# Altium project Automotive USB-C Charger.PrjPcb (part 2 of 2)
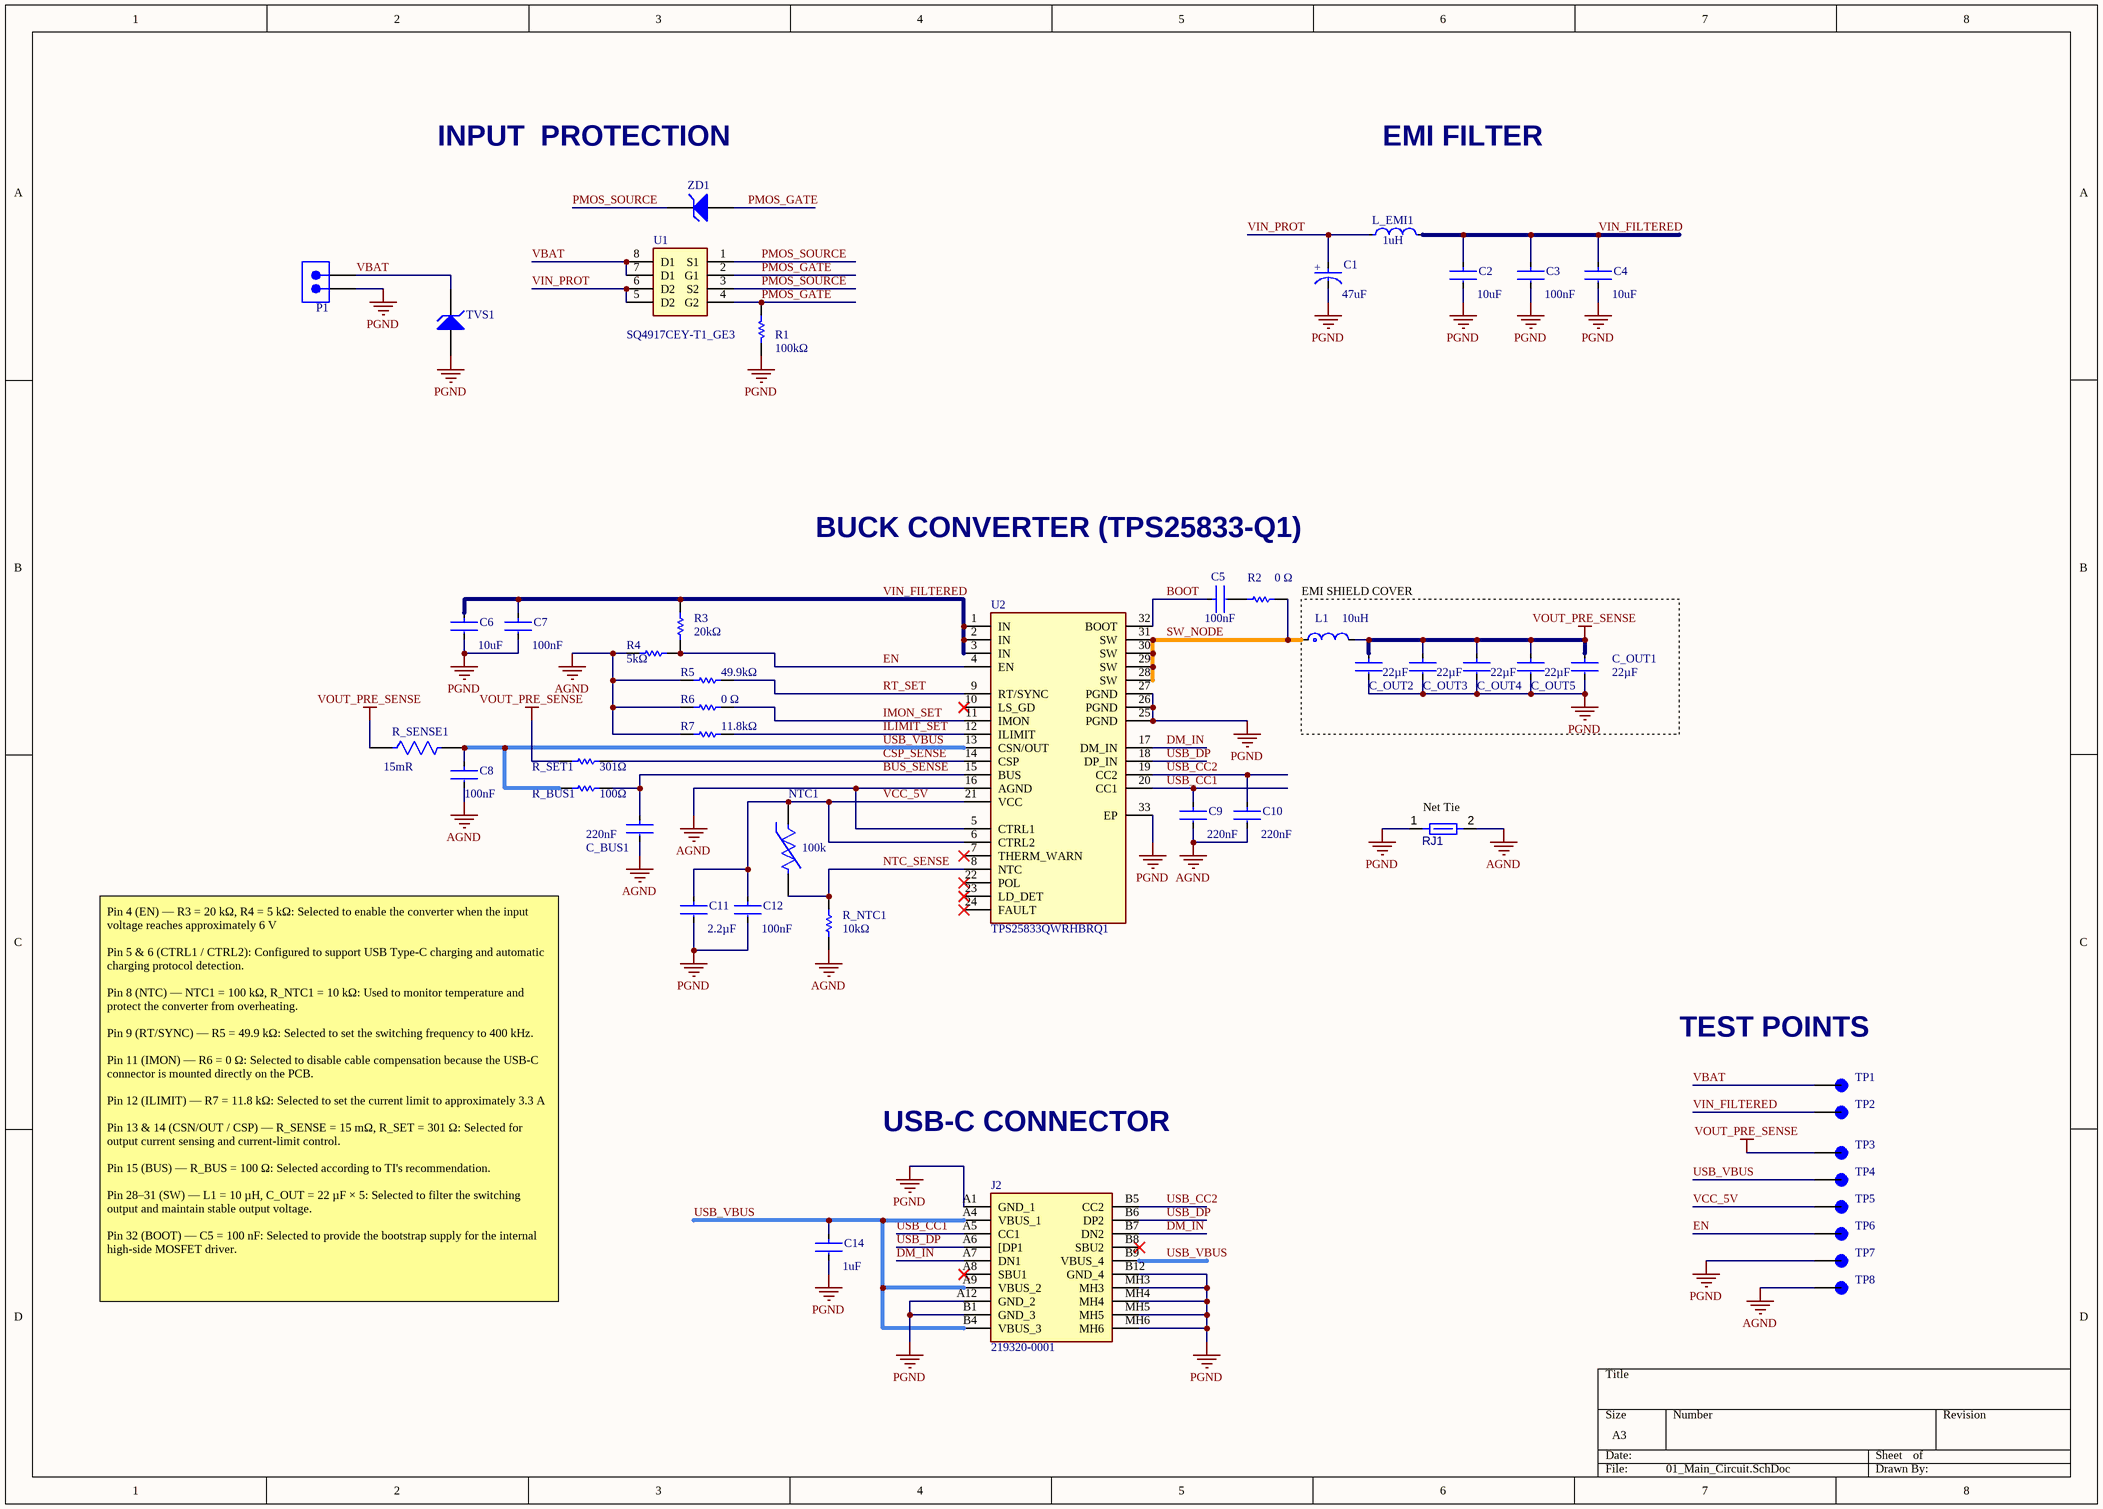
[diagram p1: 01_Main_Circuit.SchDoc]

## Sheet 01_Main_Circuit.SchDoc (continued)

### Library data of the parts
C1 = CMP-03015-000011-1: CAP ALUM 47UF 20% 50V SMD; RoHS Compliant: Yes
C2 C4 C6 = CMP-08246-001891-1: Cap Ceramic 10uF 50V X7R 10% Pad SMD 1206 +125°C Automotive T/R; Voltage Rating: 50V; Case/Package: 1206; Ratings: AEC-Q200; Mount: Surface Mount; Max Operating Temperature: 125°C; Min Operating Temperature: -55°C; Tolerance: 10%; Packaging: Tape and Reel; Case Code (Metric): 3216; Case Code (Imperial): 1206
C3 C5 C7 C8 = CMP-2000-07546-2: Cap Ceramic 100nF 50V X7R 10% Pad SMD 0603 +125°C Automotive T/R; Weight: 7.1E-05oz; Composition: Ceramic; Max Operating Temperature: 125°C; Termination: SMD/SMT; Dielectric: X7R; Length: 1.6mm; Package Quantity: 1; REACH SVHC: No SVHC; Lead Free: Lead Free; Case Code (Metric): 1608; Min Operating Temperature: -55°C; Packaging: Tape and Reel; Tolerance: 10%; Voltage Rating: 50V; Case Code (Imperial): 0603; Case/Package: 0603; Voltage Rating (DC): 50V; Depth: 0.8mm; Radiation Hardening: No; Ratings: AEC-Q200; Mount: Surface Mount; Voltage: 50V; Thickness: 0.035inch; Width: 0.8mm; Height: 0.8mm
C9 C10 C_BUS1 = CMP-2000-06086-2: 25V 220nF X5R 卤20% 0402 Multilayer Ceramic Capacitors MLCC - SMD/SMT ROHS; Manufacturer: TDK; Manufacturer Lifecycle Status: PRODUCTION (NOT RECOMMENDED FOR NEW DESIGN); Tolerance: 20%; Supplier: Avnet; Supplier Part Number: C1005X5R1E224M050BC; Manufacturer Part Number: C1005X5R1E224M050BC; RoHS: Compliant; Category: Ceramic Capacitors; Pricing: 10000=0.0212 (USD); Case/Package: 0402; Case Code (Imperial): 0402; Case Code (Metric): 1005; China RoHS: Compliant; Composition: Ceramic; Depth: 500µm; Dielectric: X5R; Dielectric Material: Ceramic; Export Control Classification Number (ECCN) Code: EAR99; Height: 500µm; Harmonized Tariff Schedule (HTS) Code: 8532.24.00.20; Introduction Date: 2012-08-21; Lead Free: Lead Free; Length: 1mm; Lifecycle Status: NRND; Material: Ceramic; Max Length: 1.05mm; Max Operating Temperature: 85°C; Max Width: 550µm; Min Length: 950µm; Min Operating Temperature: -55°C; Min Width: 450µm; Mounting Technology: Surface Mount; Number of Terminals: 2; REACH SVHC: Unaffected; Termination: SMD/SMT; Voltage Rating: 25V; Voltage Rating (DC): 25V; Weight: 652.039032µg; Width: 500µm; ComponentLink1URL: https://datasheet.octopart.com:443/C1005X5R1E224M050BC-TDK-datasheet-175423548.pdf?src-supplier=IHS; ComponentLink1Description: https://datasheet.octopart.com:443/C1005X5R1E224M050BC-TDK-datasheet-175423548.pdf?src-supplier=IHS; ComponentLink2URL: https://datasheet.octopart.com:443/C1005X5R1E224M050BC-TDK-datasheet-151546523.pdf?src-supplier=TDK; ComponentLink2Description: https://datasheet.octopart.com:443/C1005X5R1E224M050BC-TDK-datasheet-151546523.pdf?src-supplier=TDK; ComponentLink3URL: https://datasheet.octopart.com/C1005X5R1E224M050BC-TDK-datasheet-41194876.pdf; ComponentLink3Description: https://datasheet.octopart.com/C1005X5R1E224M050BC-TDK-datasheet-41194876.pdf; ComponentLink4URL: https://datasheet.octopart.com/C-Series-Ceramic-Chip-Capacitors-TDK-datasheet-family-84.pdf; ComponentLink4Description: https://datasheet.octopart.com/C-Series-Ceramic-Chip-Capacitors-TDK-datasheet-family-84.pdf; ComponentLink5URL: https://datasheet.octopart.com:443/C1005X5R1E224M050BC-TDK-datasheet-82475248.pdf?src-supplier=Newark; ComponentLink5Description: https://datasheet.octopart.com:443/C1005X5R1E224M050BC-TDK-datasheet-82475248.pdf?src-supplier=Newark; ComponentLink6URL: https://datasheet.octopart.com:443/C1005X5R1E224M050BC-TDK-datasheet-13444418.pdf?src-supplier=Future+Electronics; ComponentLink6Description: https://datasheet.octopart.com:443/C1005X5R1E224M050BC-TDK-datasheet-13444418.pdf?src-supplier=Future+Electronics; ComponentLink7URL: https://datasheet.octopart.com:443/C1005X5R1E224M050BC-TDK-datasheet-17817446.pdf?src-supplier=Future+Electronics; ComponentLink7Description: https://datasheet.octopart.com:443/C1005X5R1E224M050BC-TDK-datasheet-17817446.pdf?src-supplier=Future+Electronics; ComponentLink8URL: https://datasheet.octopart.com:443/C1005X5R1E224M050BC-TDK-datasheet-10921857.pdf?src-supplier=Electro+Sonic; ComponentLink8Description: https://datasheet.octopart.com:443/C1005X5R1E224M050BC-TDK-datasheet-10921857.pdf?src-supplier=Electro+Sonic; ComponentLink9URL: http://sigma.octopart.com:80/rohs_certificate/C-Series-Ceramic-Chip-Capacitors-TDK-family-108.pdf?src-supplier=Compliance+Statements; ComponentLink9Description: http://sigma.octopart.com:80/rohs_certificate/C-Series-Ceramic-Chip-Capacitors-TDK-family-108.pdf?src-supplier=Compliance+Statements
C11 = CMP-2000-06086-2: 25V 2.2uF X5R ±10% 0402 Multilayer Ceramic Capacitors MLCC - SMD/SMT ROHS; Manufacturer: Murata; Manufacturer Lifecycle Status: IN PRODUCTION; Supplier: Future Electronics; Supplier Part Number: GRT155R61E225KE13D; Manufacturer Part Number: GRT155R61E225KE13D; RoHS: Compliant; Category: Ceramic Capacitors; Stock: 170000; Pricing: 10000=0.168 (USD); Case/Package: 0402; Case Code (Imperial): 0402; Case Code (Metric): 1005; Dielectric: X5R; Dielectric Material: Ceramic; Export Control Classification Number (ECCN) Code: EAR99; Height: 500µm; Harmonized Tariff Schedule (HTS) Code: 8532.24.00.20; Introduction Date: 2016-01-27; Length: 1mm; Lifecycle Status: Production; Material: Ceramic; Max Operating Temperature: 85°C; Min Operating Temperature: -55°C; Mounting Technology: Surface Mount; Number of Terminals: 2; Packaging: Cut Tape; Ratings: AEC-Q200; REACH SVHC: Unaffected; Schedule B: 8532240020, 8532240020|8532240020, 8532240020|8532240020|8532240020, 8532240020|8532240020|8532240020|8532240020; Tolerance: 10%; Voltage Rating: 25V; Voltage Rating (DC): 25V; Width: 500µm; ComponentLink1URL: https://datasheet.octopart.com:443/GRT155R61E225KE13D-Murata-datasheet-149523572.pdf?src-supplier=Farnell; ComponentLink1Description: https://datasheet.octopart.com:443/GRT155R61E225KE13D-Murata-datasheet-149523572.pdf?src-supplier=Farnell; ComponentLink2URL: https://datasheet.octopart.com:443/GRT155R61E225KE13D-Murata-datasheet-67697706.pdf?src-supplier=Newark; ComponentLink2Description: https://datasheet.octopart.com:443/GRT155R61E225KE13D-Murata-datasheet-67697706.pdf?src-supplier=Newark; ComponentLink3URL: https://datasheet.octopart.com:443/GRT155R61E225KE13D-Murata-datasheet-141283924.pdf?src-supplier=Geoflip; ComponentLink3Description: https://datasheet.octopart.com:443/GRT155R61E225KE13D-Murata-datasheet-141283924.pdf?src-supplier=Geoflip; ComponentLink4URL: https://datasheet.octopart.com:443/GRT155R61E225KE13D-Murata-datasheet-178522875.pdf?src-supplier=Arrow.cn; ComponentLink4Description: https://datasheet.octopart.com:443/GRT155R61E225KE13D-Murata-datasheet-178522875.pdf?src-supplier=Arrow.cn; ComponentLink5URL: https://datasheet.octopart.com:443/GRT155R61E225KE13D-Murata-datasheet-165579666.pdf?src-supplier=TME; ComponentLink5Description: https://datasheet.octopart.com:443/GRT155R61E225KE13D-Murata-datasheet-165579666.pdf?src-supplier=TME; ComponentLink6URL: https://datasheet.octopart.com:443/GRT155R61E225KE13D-Murata-datasheet-140711002.pdf?src-supplier=Ciiva; ComponentLink6Description: https://datasheet.octopart.com:443/GRT155R61E225KE13D-Murata-datasheet-140711002.pdf?src-supplier=Ciiva; ComponentLink7URL: https://datasheet.octopart.com:443/GRT155R61E225KE13D-Murata-datasheet-138748731.pdf?src-supplier=Ciiva; ComponentLink7Description: https://datasheet.octopart.com:443/GRT155R61E225KE13D-Murata-datasheet-138748731.pdf?src-supplier=Ciiva; ComponentLink8URL: https://datasheet.octopart.com:443/GRT155R61E225KE13D-Murata-datasheet-82944872.pdf?src-supplier=Future+Electronics; ComponentLink8Description: https://datasheet.octopart.com:443/GRT155R61E225KE13D-Murata-datasheet-82944872.pdf?src-supplier=Future+Electronics; ComponentLink9URL: http://sigma.octopart.com:80/reach_statement/Murata-company-16.pdf?src-supplier=Compliance+Statements; ComponentLink9Description: http://sigma.octopart.com:80/reach_statement/Murata-company-16.pdf?src-supplier=Compliance+Statements
C12 = CMP-2000-06086-2: Cap Ceramic 100nF 25V X7R 10% Pad SMD 0402 +125°C Automotive T/R; Lead Free: Lead Free; Termination: SMD/SMT; Voltage Rating: 25V; Voltage: 25V; Composition: Ceramic; Case/Package: 0402; Mount: Surface Mount; Voltage Rating (DC): 25V; Tolerance: 10%; Length: 1mm; Width: 0.02inch; REACH SVHC: No SVHC; Max Operating Temperature: 125°C; Case Code (Metric): 1005; Case Code (Imperial): 0402; Package Quantity: 1; Depth: 0.5mm; Min Operating Temperature: -55°C; Thickness: 0.022inch; Height: 0.5mm; Dielectric: X7R; Packaging: Tape and Reel; Weight: 2.3E-05oz; Ratings: AEC-Q200
C14 = CMP-08246-000763-1: Cap Ceramic 1uF 10V X5R 10% Pad SMD 0603 +85°C Automotive T/R; Case/Package: 0603; Height: 0.8mm; Mount: Surface Mount; Voltage Rating: 10V; Tolerance: 10%; Thickness: 0.035inch; Dielectric: X5R; Case Code (Metric): 1608; Ratings: AEC-Q200; Package Quantity: 4000; Packaging: Tape and Reel; Width: 0.031inch; Voltage Rating (DC): 10V; Case Code (Imperial): 0603; Max Operating Temperature: 85°C; Weight: 7.1E-05oz; Min Operating Temperature: -55°C; Length: 0.063inch
C_OUT1-C_OUT5 = CMP-08246-001891-1: CAP CER 22UF 25V X5R 1206 / 22 µF ±10% 25V Ceramic Capacitor X5R 1206 (3216 Metric); Manufacturer: Murata; Manufacturer Lifecycle Status: NRND; Supplier: Arrow Electronics; Supplier Part Number: GRT31CR61E226KE01L; Manufacturer Part Number: GRT31CR61E226KE01L; RoHS: Compliant; Category: Ceramic Capacitors; Stock: 257; Pricing: 44=1.6387, 100=1.5267 (USD); Case/Package: 1206; Case Code (Imperial): 1206; Case Code (Metric): 3216; Dielectric: X5R; Dielectric Material: Ceramic; Export Control Classification Number (ECCN) Code: EAR99; Height: 1.6mm; Harmonized Tariff Schedule (HTS) Code: 8532.24.00.20; Introduction Date: 2016-01-27; Length: 3.2mm; Lifecycle Status: NRND; Max Operating Temperature: 85°C; Min Operating Temperature: -55°C; Mounting Technology: Surface Mount; Number of Terminals: 2; Packaging: Cut Tape; Ratings: AEC-Q200; REACH SVHC: Unaffected; Schedule B: 8532240020, 8532240020|8532240020|8532240020|8532240020|8532240020; Tolerance: 10%; Voltage Rating: 25V; Voltage Rating (DC): 25V; Width: 1.6mm; ComponentLink1URL: https://datasheet.octopart.com:443/GRT31CR61E226KE01L-Murata-datasheet-67697882.pdf?src-supplier=HQonline; ComponentLink1Description: https://datasheet.octopart.com:443/GRT31CR61E226KE01L-Murata-datasheet-67697882.pdf?src-supplier=HQonline; ComponentLink2URL: https://datasheet.octopart.com:443/GRT31CR61E226KE01L-Murata-datasheet-141285200.pdf?src-supplier=Geoflip; ComponentLink2Description: https://datasheet.octopart.com:443/GRT31CR61E226KE01L-Murata-datasheet-141285200.pdf?src-supplier=Geoflip; ComponentLink3URL: https://datasheet.octopart.com:443/GRT31CR61E226KE01L-Murata-datasheet-140711510.pdf?src-supplier=Ciiva; ComponentLink3Description: https://datasheet.octopart.com:443/GRT31CR61E226KE01L-Murata-datasheet-140711510.pdf?src-supplier=Ciiva; ComponentLink4URL: https://datasheet.octopart.com:443/GRT31CR61E226KE01L-Murata-datasheet-138749569.pdf?src-supplier=Ciiva; ComponentLink4Description: https://datasheet.octopart.com:443/GRT31CR61E226KE01L-Murata-datasheet-138749569.pdf?src-supplier=Ciiva; ComponentLink5URL: https://datasheet.octopart.com:443/GRT31CR61E226KE01L-Murata-datasheet-128593529.pdf?src-supplier=X-ON; ComponentLink5Description: https://datasheet.octopart.com:443/GRT31CR61E226KE01L-Murata-datasheet-128593529.pdf?src-supplier=X-ON; ComponentLink6URL: http://sigma.octopart.com:80/reach_statement/Murata-company-16.pdf?src-supplier=Compliance+Statements; ComponentLink6Description: http://sigma.octopart.com:80/reach_statement/Murata-company-16.pdf?src-supplier=Compliance+Statements
J2 = 219320-0001: Universal Serial Bus (USB) Shielded I/O Receptacle, Type C, Vertical, Surface Mount, Height 8.8mm, 16 Circuits, Gold (Au) Flash Plating; Manufacturer_Name: Molex; Geometry.Height: 9.05mm; Mouser Part Number: 538-219320-0001; Mouser Price/Stock: https://www.mouser.co.uk/ProductDetail/Molex/219320-0001?qs=rQFj71Wb1eXha8qVBIXu3A%3D%3D; Manufacturer_Part_Number: 219320-0001; Datasheet Link: https://www.molex.com/content/dam/molex/molex-dot-com/products/automated/en-us/salesdrawingpdf/219/219320/2193200001_sd.pdf?inline
L1 = CMP-11268-000112-1: Power inductor, shielded,10uH 20% tol, 29.82mOhms, SMT, RoHS, Halogen Free, AEC - Q200; Self Resonant Frequency: 14MHz; Core Material: Composite; Max DC Current: 7A; Test Frequency: 100kHz; DC Resistance (DCR): 29.82mR; Package Quantity: 21; Length: 6.76mm; RoHS Compliant: Yes; Min Operating Temperature: -40°C; Tolerance: 20%; Max Operating Temperature: 125°C; Series: XAL6060; Termination: SMD/SMT; Shielding: Shielded; Height: 6.1mm; Lead Free: Contains Lead; Width: 6.56mm; Packaging: Tape and Reel
L_EMI1 = CMP-11268-000037-1: Fixed Inductors 1uH 20% 9.6A 14.60mOhms AEC-Q200; Manufacturer: Coilcraft; Saturation Current: 8.7A; Core Material: Composite; Test Frequency: 1MHz; Standoff Height: 0.1mm; Shielding: true; Automotive Grade: Grade 1; Self Resonant Frequency: 79MHz; Series Resistance: 14.6mΩ; Rms Current: 9.6A; Category: Ind; RoHS: TRUE; Device Class L2: Inductors; Mouser Description: Power inductor, shielded, 20% tol, SMT, RoHS, halogen f; Lead Free: Yes; Device Class L1: Passive Components; Inductance: 1uH; ComponentLink2URL: https://www.coilcraft.com/pdfs/xal4000.pdf; Height: 2.1mm; Device Class L3: Fixed Inductors; Composition: Wirewound; Package: 0; Ambient Temperature Range Low: -40°C; Automotive: Yes; Ambient Temperature Range High: +125°C; ComponentLink2Description: Datasheet; Octopart: https://octopart.com/xal4020-102mec-coilcraft-13142161; Tolerance: 20%; Manufacturer Part Number: XAL4020-102MEC
NTC1 = CMP-06022-000152-2: THERMISTOR NTC; Max Operating Temperature: 150°C; RoHS Compliant: Yes; Min Operating Temperature: -40°C; REACH SVHC: No SVHC; Case Code (Imperial): 0603; Case Code (Metric): 1608
P1 = CMP-03913-107328823-2: Conn, R/A Hdr, Stamped Tab, 2P, 5.08Mm Rohs Compliant: Yes; Gender: Male
R1 = CMP-1012-00736-1: 100K 0.1W 1% 0603 (1608 Metric)  SMD; Case-Metric: 1608; Case-EIA: 0603; Power: 0.1 W; Tolerance: 1 %; Technology: SMT
R2 R6 = CMP-2000-07451-1: Chip Resistor, 0 Ohm, 0.1 W, -55 to 155 degC, 0402 (1005 Metric), RoHS, Tape and Reel; Manufacturer: Panasonic; Voltage Rating (DC): 50V; Temperature Coefficient: 600ppm/��C; Max Power Dissipation: 100mW; Tolerance: 5%; Number of Terminations: 2; Mount: SurfaceMount; Height: 0.35mm; Packaging: TapeandReel; Contact Plating: Tin; Manufacturer URL: http://www.panasonic.com/; Composition: ThickFilm; Max Operating Temperature: 155degC; REACH SVHC: NoSVHC; Case/Package: 0402; Package Reference: 402; Depth: 0.5mm; Package Description: 2-Pin Surface Mount Device, Body 1 x 0.5 mm; Datasheet URL: https://industrial.panasonic.com/cdbs/www-data/pdf/RDA0000/AOA0000C301.pdf; RoHSCompliant: True; Case Code (Imperial): 0402; Military Standard: Not; Min Operating Temperature: -55degC; Power Rating: 100mW; Datasheet Version: 03/2015; Length: 1mm; Case Code (Metric): 1005; Termination: SMD/SMT; Mounting Technology: SurfaceMount; Voltage Rating: 50V; Width: 0.02inch; Package Quantity: 1; Lead Free: LeadFree; Radiation Hardening: No
R3 = CMP-2000-07451-1: Manufacturer: Yageo Group; Manufacturer Part Number: AC0402FR-7W20KL; Power Rating: 125mW; Temperature Coefficient: 100ppm/°C; Tolerance: 1%; Voltage Rating: 50V; Working Voltage: 75V; Supplier: Future Electronics; Supplier Part Number: AC0402FR-7W20KL; RoHS: Compliant; Category: Chip SMD Resistors; Stock: 120000; Pricing: 10000=0.0077, 30000=0.0075, 50000=0.0074, 100000=0.0073, 200000=0.0071 (USD); Case/Package: 0402; China RoHS: Non-Compliant; Composition: Thick Film; Country of Origin: Mainland China, Taiwan; Export Control Classification Number (ECCN) Code: EAR99; Height: 320µm; Harmonized Tariff Schedule (HTS) Code: 8533.21.00.30; Introduction Date: 2017-06-20; Length: 1mm; Lifecycle Status: Production; Max Operating Temperature: 155°C; Min Operating Temperature: -55°C; Mounting Technology: Surface Mount; Number of Terminals: 2; Packaging: Tape & Reel; Ratings: AEC-Q200; REACH SVHC: Unaffected; Width: 500µm; ComponentLink1URL: https://datasheet.octopart.com:443/AC0402FR-7W20KL-Yageo-datasheet-182189377.pdf?src-supplier=IHS; ComponentLink1Description: https://datasheet.octopart.com:443/AC0402FR-7W20KL-Yageo-datasheet-182189377.pdf?src-supplier=IHS; ComponentLink2URL: https://datasheet.octopart.com:443/AC0402FR-7W20KL-Yageo-datasheet-83209224.pdf?src-supplier=Upverter; ComponentLink2Description: https://datasheet.octopart.com:443/AC0402FR-7W20KL-Yageo-datasheet-83209224.pdf?src-supplier=Upverter; ComponentLink3URL: https://datasheet.octopart.com:443/AC0402FR-7W20KL-Yageo-datasheet-178509465.pdf?src-supplier=Farnell; ComponentLink3Description: https://datasheet.octopart.com:443/AC0402FR-7W20KL-Yageo-datasheet-178509465.pdf?src-supplier=Farnell; ComponentLink4URL: https://datasheet.octopart.com:443/AC0402FR-7W20KL-Yageo-datasheet-166720450.pdf?src-supplier=Future+Electronics; ComponentLink4Description: https://datasheet.octopart.com:443/AC0402FR-7W20KL-Yageo-datasheet-166720450.pdf?src-supplier=Future+Electronics; ComponentLink5URL: https://datasheet.octopart.com:443/AC0402FR-7W20KL-Yageo-datasheet-151884373.pdf?src-supplier=Future+Electronics; ComponentLink5Description: https://datasheet.octopart.com:443/AC0402FR-7W20KL-Yageo-datasheet-151884373.pdf?src-supplier=Future+Electronics; ComponentLink6URL: https://datasheet.octopart.com:443/AC0402FR-7W20KL-Yageo-Group-datasheet-159083007.pdf?src-supplier=HQonline; ComponentLink6Description: https://datasheet.octopart.com:443/AC0402FR-7W20KL-Yageo-Group-datasheet-159083007.pdf?src-supplier=HQonline; ComponentLink7URL: https://datasheet.octopart.com/AC0402FR-7W20KL-Yageo-datasheet-12512238.pdf; ComponentLink7Description: https://datasheet.octopart.com/AC0402FR-7W20KL-Yageo-datasheet-12512238.pdf; ComponentLink8URL: http://sigma.octopart.com:80/conflict_mineral_statement/Yageo-company-3.pdf?src-supplier=Compliance+Statements; ComponentLink8Description: http://sigma.octopart.com:80/conflict_mineral_statement/Yageo-company-3.pdf?src-supplier=Compliance+Statements; ComponentLink9URL: http://sigma.octopart.com:80/rohs_statement/Yageo-company-2.pdf?src-supplier=Compliance+Statements; ComponentLink9Description: http://sigma.octopart.com:80/rohs_statement/Yageo-company-2.pdf?src-supplier=Compliance+Statements
R4 = CMP-2000-07451-1: Manufacturer: Yageo Group; Manufacturer Part Number: RC0402FR-075KL; Max Power Dissipation: 63mW; Power Rating: 62.5mW; Temperature Coefficient: 100ppm/°C; Tolerance: 1%; Voltage Rating: 50V; Supplier: Avnet; Supplier Part Number: RC0402FR-075KL; RoHS: Compliant; Category: Chip SMD Resistors; Stock: 9552; Pricing: 1=0.101, 25=0.011, 100=0.010, 250=0.009, 500=0.008, 1000=0.007, 2500=0.005 (USD); Case/Package: 0402; China RoHS: Non-Compliant; Composition: Thick Film; Country of Origin: Mainland China, Taiwan; Export Control Classification Number (ECCN) Code: EAR99; Features: Moisture Resistant; Height: 350µm; Harmonized Tariff Schedule (HTS) Code: 8533.21.00.30; Introduction Date: 2011-11-17; Length: 1mm; Lifecycle Status: Production; Max Operating Temperature: 155°C; Min Operating Temperature: -55°C; Mounting Technology: Surface Mount; Number of Terminals: 2; Number of Terminations: 2; REACH SVHC: Unaffected; Schedule B: 8533210045, 8533210045|8533210045|8533210045|8533210045|8533210045; Width: 500µm; Working Voltage: 50V; ComponentLink1URL: https://datasheet.octopart.com:443/RC0402FR-075KL-Yageo-datasheet-127823281.pdf?src-supplier=Upverter; ComponentLink1Description: https://datasheet.octopart.com:443/RC0402FR-075KL-Yageo-datasheet-127823281.pdf?src-supplier=Upverter; ComponentLink2URL: https://datasheet.octopart.com:443/RC0402FR-075KL-Yageo-datasheet-137700087.pdf?src-supplier=IHS; ComponentLink2Description: https://datasheet.octopart.com:443/RC0402FR-075KL-Yageo-datasheet-137700087.pdf?src-supplier=IHS; ComponentLink3URL: https://datasheet.octopart.com:443/RC0402FR-075KL-Yageo-Group-datasheet-176638170.pdf?src-supplier=Future+Electronics; ComponentLink3Description: https://datasheet.octopart.com:443/RC0402FR-075KL-Yageo-Group-datasheet-176638170.pdf?src-supplier=Future+Electronics; ComponentLink4URL: https://datasheet.octopart.com:443/RC0402FR-075KL-Yageo-datasheet-164759695.pdf?src-supplier=Future+Electronics; ComponentLink4Description: https://datasheet.octopart.com:443/RC0402FR-075KL-Yageo-datasheet-164759695.pdf?src-supplier=Future+Electronics; ComponentLink5URL: https://datasheet.octopart.com:443/RC0402FR-075KL-Yageo-datasheet-175887523.pdf?src-supplier=Newark; ComponentLink5Description: https://datasheet.octopart.com:443/RC0402FR-075KL-Yageo-datasheet-175887523.pdf?src-supplier=Newark; ComponentLink6URL: https://datasheet.octopart.com/RC0402FR-075KL-Yageo-datasheet-73766026.pdf; ComponentLink6Description: https://datasheet.octopart.com/RC0402FR-075KL-Yageo-datasheet-73766026.pdf; ComponentLink7URL: http://sigma.octopart.com:80/conflict_mineral_statement/Yageo-company-3.pdf?src-supplier=Compliance+Statements; ComponentLink7Description: http://sigma.octopart.com:80/conflict_mineral_statement/Yageo-company-3.pdf?src-supplier=Compliance+Statements; ComponentLink8URL: http://sigma.octopart.com:80/rohs_statement/Yageo-company-2.pdf?src-supplier=Compliance+Statements; ComponentLink8Description: http://sigma.octopart.com:80/rohs_statement/Yageo-company-2.pdf?src-supplier=Compliance+Statements
R5 = CMP-2000-07451-1: Manufacturer: Panasonic; Manufacturer Part Number: ERJ2RKF4992X; Manufacturer Lifecycle Status: ACTIVE; Part Series: Precision Thick Film Chip Resistors; Max Power Dissipation: 100mW; Temperature Coefficient: 100ppm/°C; Tolerance: 1%; Voltage Rating: 50V; Supplier: Future Electronics; Supplier Part Number: ERJ-2RKF4992X; RoHS: Compliant; Category: Chip SMD Resistors; Stock: 150000; Pricing: 10000=0.0105, 30000=0.0102, 50000=0.0099, 150000=0.0097, 250000=0.0094 (USD); Case/Package: 0402; Case Code (Imperial): 0402; China RoHS: Non-Compliant; Composition: Thick Film; Contact Plating: Tin; Country of Origin: Japan, Mainland China; Depth: 500µm; Export Control Classification Number (ECCN) Code: EAR99; Features: Automotive AEC-Q200; Height: 350µm; Harmonized Tariff Schedule (HTS) Code: 8533.21.00.30; Introduction Date: 2004-02-02; Lead Free: Lead Free; Length: 1mm; Lifecycle Status: Production; Max Operating Temperature: 155°C; Military Standard: Not; Min Operating Temperature: -55°C; Mounting Technology: Surface Mount; Number of Terminals: 2; Number of Terminations: 2; Packaging: Cut Tape; Power Rating: 100mW; Radiation Hardening: No; Ratings: AEC-Q200; REACH SVHC: Unaffected; Schedule B: 8533210045, 8533210045|8533210045|8533210045|8533210045|8533210045; Termination: SMD/SMT; Voltage Rating (DC): 50V; Width: 500µm; Working Voltage: 50V; ComponentLink1URL: https://datasheet.octopart.com:443/ERJ2RKF4992X-Panasonic-datasheet-82288794.pdf?src-supplier=Upverter; ComponentLink1Description: https://datasheet.octopart.com:443/ERJ2RKF4992X-Panasonic-datasheet-82288794.pdf?src-supplier=Upverter; ComponentLink2URL: https://datasheet.octopart.com:443/ERJ2RKF4992X-Panasonic-datasheet-13266541.pdf?src-supplier=RS+(Formerly+Allied+Electronics); ComponentLink2Description: https://datasheet.octopart.com:443/ERJ2RKF4992X-Panasonic-datasheet-13266541.pdf?src-supplier=RS+(Formerly+Allied+Electronics); ComponentLink3URL: https://datasheet.octopart.com:443/ERJ2RKF4992X-Panasonic-datasheet-10025800.pdf?src-supplier=Future+Electronics; ComponentLink3Description: https://datasheet.octopart.com:443/ERJ2RKF4992X-Panasonic-datasheet-10025800.pdf?src-supplier=Future+Electronics; ComponentLink4URL: https://datasheet.octopart.com:443/ERJ2RKF4992X-Panasonic-datasheet-8853621.pdf?src-supplier=Future+Electronics; ComponentLink4Description: https://datasheet.octopart.com:443/ERJ2RKF4992X-Panasonic-datasheet-8853621.pdf?src-supplier=Future+Electronics; ComponentLink5URL: https://datasheet.octopart.com:443/ERJ2RKF4992X-Panasonic-datasheet-5313456.pdf?src-supplier=Future+Electronics; ComponentLink5Description: https://datasheet.octopart.com:443/ERJ2RKF4992X-Panasonic-datasheet-5313456.pdf?src-supplier=Future+Electronics; ComponentLink6URL: https://datasheet.octopart.com:443/ERJ2RKF4992X-Panasonic-datasheet-48891056.pdf?src-supplier=Newark; ComponentLink6Description: https://datasheet.octopart.com:443/ERJ2RKF4992X-Panasonic-datasheet-48891056.pdf?src-supplier=Newark; ComponentLink7URL: https://datasheet.octopart.com:443/ERJ2RKF4992X-Panasonic-datasheet-136608610.pdf?src-supplier=Newark; ComponentLink7Description: https://datasheet.octopart.com:443/ERJ2RKF4992X-Panasonic-datasheet-136608610.pdf?src-supplier=Newark; ComponentLink8URL: https://datasheet.octopart.com:443/ERJ-2RKF4992X-Panasonic-datasheet-154766169.pdf?src-supplier=JRH+Electronics; ComponentLink8Description: https://datasheet.octopart.com:443/ERJ-2RKF4992X-Panasonic-datasheet-154766169.pdf?src-supplier=JRH+Electronics; ComponentLink9URL: https://datasheet.octopart.com:443/ERJ2RKF4992X-Panasonic-datasheet-164353789.pdf?src-supplier=HQonline; ComponentLink9Description: https://datasheet.octopart.com:443/ERJ2RKF4992X-Panasonic-datasheet-164353789.pdf?src-supplier=HQonline; ComponentLink10URL: https://datasheet.octopart.com:443/ERJ2RKF4992X-Panasonic-datasheet-188592431.pdf?src-supplier=TME; ComponentLink10Description: https://datasheet.octopart.com:443/ERJ2RKF4992X-Panasonic-datasheet-188592431.pdf?src-supplier=TME; ComponentLink11URL: https://datasheet.octopart.com/ERJ2RKF4992X-Panasonic-datasheet-78375410.pdf; ComponentLink11Description: https://datasheet.octopart.com/ERJ2RKF4992X-Panasonic-datasheet-78375410.pdf; ComponentLink12URL: https://datasheet.octopart.com:443/ERJ-2RKF4992X-Panasonic---ECG-datasheet-15994758.pdf?src-supplier=Farnell; ComponentLink12Description: https://datasheet.octopart.com:443/ERJ-2RKF4992X-Panasonic---ECG-datasheet-15994758.pdf?src-supplier=Farnell; ComponentLink13URL: https://datasheet.octopart.com:443/ERJ2RKF4992X-Panasonic-datasheet-7538305.pdf?src-supplier=Jameco+(USA); ComponentLink13Description: https://datasheet.octopart.com:443/ERJ2RKF4992X-Panasonic-datasheet-7538305.pdf?src-supplier=Jameco+(USA); ComponentLink14URL: https://datasheet.octopart.com:443/ERJ-2RKF4992X-Panasonic-datasheet-118621.pdf?src-supplier=DigiKey; ComponentLink14Description: https://datasheet.octopart.com:443/ERJ-2RKF4992X-Panasonic-datasheet-118621.pdf?src-supplier=DigiKey; ComponentLink15URL: https://datasheet.octopart.com:443/ERJ-2RKF4992X-Panasonic-datasheet-41391857.pdf?src-supplier=Electro+Sonic; ComponentLink15Description: https://datasheet.octopart.com:443/ERJ-2RKF4992X-Panasonic-datasheet-41391857.pdf?src-supplier=Electro+Sonic
R7 R_SET1 = CMP-2000-07451-1: Manufacturer: Vishay; Max Power Dissipation: 63mW; Temperature Coefficient: 100ppm/°C; Tolerance: 1%; Voltage Rating: 50V; RoHS: Compliant; Category: Chip SMD Resistors; Case/Package: 0402; China RoHS: Non-Compliant; Composition: Thick Film; Contact Plating: Tin; Features: Automotive AEC-Q200; Height: 350µm; Lead Free: Lead Free; Length: 1mm; Lifecycle Status: Production; Max Operating Temperature: 155°C; Min Operating Temperature: -55°C; Mounting Technology: Surface Mount; Number of Terminals: 2; Number of Terminations: 2; Power Rating: 63mW; Radiation Hardening: No; Ratings: AEC-Q200; REACH SVHC: Unaffected; Schedule B: 8533210045, 8533210045|8533210045|8533210045|8533210045|8533210045|8533210045|8533210045|8533210045|8533210045|8533210045|8533210045|8533210045|8533210045|8533210045|8533210045|8533210045|8533210045|8533210045|8533210045|8533210045|8533210045|8533210045|8533210045|85; Width: 500µm; Working Voltage: 50V
  R7: Supplier: Avnet; Supplier Part Number: CRCW040211K8FKEE; Manufacturer Part Number: CRCW040211K8FKEE; Stock: 50000; Pricing: 50000=0.00784, 100000=0.0078, 200000=0.00776, 400000=0.00772, 800000=0.00768 (USD); Country of Origin: Israel, Taiwan; Export Control Classification Number (ECCN) Code: EAR99; Harmonized Tariff Schedule (HTS) Code: 8533.21.00.30; Introduction Date: 2005-12-02; Packaging: Tape & Reel (TR); ComponentLink1URL: https://datasheet.octopart.com:443/CRCW040211K8FKEE-Vishay-datasheet-175423584.pdf?src-supplier=IHS; ComponentLink1Description: https://datasheet.octopart.com:443/CRCW040211K8FKEE-Vishay-datasheet-175423584.pdf?src-supplier=IHS; ComponentLink2URL: https://datasheet.octopart.com:443/CRCW040211K8FKEE-Vishay-datasheet-62316123.pdf?src-supplier=JRH+Electronics; ComponentLink2Description: https://datasheet.octopart.com:443/CRCW040211K8FKEE-Vishay-datasheet-62316123.pdf?src-supplier=JRH+Electronics; ComponentLink3URL: https://datasheet.octopart.com:443/CRCW040211K8FKEE-Vishay-datasheet-193386866.pdf?src-supplier=JRH+Electronics; ComponentLink3Description: https://datasheet.octopart.com:443/CRCW040211K8FKEE-Vishay-datasheet-193386866.pdf?src-supplier=JRH+Electronics; ComponentLink4URL: http://sigma.octopart.com:80/rohs_statement/Vishay-company-15.pdf?src-supplier=Compliance+Statements; ComponentLink4Description: http://sigma.octopart.com:80/rohs_statement/Vishay-company-15.pdf?src-supplier=Compliance+Statements
  R_SET1: Supplier: Future Electronics; Supplier Part Number: CRCW0402301RFKED; Manufacturer Part Number: CRCW0402301RFKED; Stock: 190000; Pricing: 10000=0.0043, 40000=0.0042, 150000=0.004, 250000=0.0039, 500000=0.0038 (USD); Case Code (Imperial): 0402; Depth: 500µm; Military Standard: Not; Pins: 2; Packaging: Cut Tape; Termination: SMD/SMT; Voltage Rating (DC): 50V; Weight: 652.039032µg; ComponentLink1URL: https://datasheet.octopart.com:443/CRCW0402301RFKED-Vishay-datasheet-175423584.pdf?src-supplier=IHS; ComponentLink1Description: https://datasheet.octopart.com:443/CRCW0402301RFKED-Vishay-datasheet-175423584.pdf?src-supplier=IHS; ComponentLink2URL: https://datasheet.octopart.com:443/CRCW0402301RFKED-Vishay-datasheet-83961561.pdf?src-supplier=element14+APAC; ComponentLink2Description: https://datasheet.octopart.com:443/CRCW0402301RFKED-Vishay-datasheet-83961561.pdf?src-supplier=element14+APAC; ComponentLink3URL: https://datasheet.octopart.com:443/CRCW0402301RFKED-Vishay-datasheet-10882403.pdf?src-supplier=element14+APAC; ComponentLink3Description: https://datasheet.octopart.com:443/CRCW0402301RFKED-Vishay-datasheet-10882403.pdf?src-supplier=element14+APAC; ComponentLink4URL: https://datasheet.octopart.com:443/CRCW0402301RFKED-Vishay-datasheet-159614168.pdf?src-supplier=element14+APAC; ComponentLink4Description: https://datasheet.octopart.com:443/CRCW0402301RFKED-Vishay-datasheet-159614168.pdf?src-supplier=element14+APAC; ComponentLink5URL: https://datasheet.octopart.com:443/CRCW0402301RFKED-Vishay-datasheet-66077789.pdf?src-supplier=Newark; ComponentLink5Description: https://datasheet.octopart.com:443/CRCW0402301RFKED-Vishay-datasheet-66077789.pdf?src-supplier=Newark; ComponentLink6URL: https://datasheet.octopart.com:443/CRCW0402301RFKED-Vishay-datasheet-11516975.pdf?src-supplier=Newark; ComponentLink6Description: https://datasheet.octopart.com:443/CRCW0402301RFKED-Vishay-datasheet-11516975.pdf?src-supplier=Newark; ComponentLink7URL: https://datasheet.octopart.com:443/CRCW0402301RFKED-Vishay-datasheet-41302739.pdf?src-supplier=Newark; ComponentLink7Description: https://datasheet.octopart.com:443/CRCW0402301RFKED-Vishay-datasheet-41302739.pdf?src-supplier=Newark; ComponentLink8URL: https://datasheet.octopart.com:443/CRCW0402301RFKED-Vishay-datasheet-33013972.pdf?src-supplier=Newark; ComponentLink8Description: https://datasheet.octopart.com:443/CRCW0402301RFKED-Vishay-datasheet-33013972.pdf?src-supplier=Newark; ComponentLink9URL: https://datasheet.octopart.com:443/CRCW0402301RFKED-Vishay-datasheet-21226360.pdf?src-supplier=Newark; ComponentLink9Description: https://datasheet.octopart.com:443/CRCW0402301RFKED-Vishay-datasheet-21226360.pdf?src-supplier=Newark; ComponentLink10URL: https://datasheet.octopart.com:443/CRCW0402301RFKED-Vishay-datasheet-62317933.pdf?src-supplier=Farnell; ComponentLink10Description: https://datasheet.octopart.com:443/CRCW0402301RFKED-Vishay-datasheet-62317933.pdf?src-supplier=Farnell; ComponentLink11URL: https://datasheet.octopart.com:443/CRCW0402301RFKED-Vishay-datasheet-14722531.pdf?src-supplier=Farnell; ComponentLink11Description: https://datasheet.octopart.com:443/CRCW0402301RFKED-Vishay-datasheet-14722531.pdf?src-supplier=Farnell; ComponentLink12URL: https://datasheet.octopart.com:443/CRCW0402301RFKED-Vishay-datasheet-5300368.pdf?src-supplier=Farnell; ComponentLink12Description: https://datasheet.octopart.com:443/CRCW0402301RFKED-Vishay-datasheet-5300368.pdf?src-supplier=Farnell; ComponentLink13URL: https://datasheet.octopart.com:443/CRCW0402301RFKED-Vishay-datasheet-190005712.pdf?src-supplier=TME; ComponentLink13Description: https://datasheet.octopart.com:443/CRCW0402301RFKED-Vishay-datasheet-190005712.pdf?src-supplier=TME; ComponentLink14URL: https://datasheet.octopart.com:443/CRCW0402301RFKED-Vishay-datasheet-62316122.pdf?src-supplier=Future+Electronics; ComponentLink14Description: https://datasheet.octopart.com:443/CRCW0402301RFKED-Vishay-datasheet-62316122.pdf?src-supplier=Future+Electronics; ComponentLink15URL: https://datasheet.octopart.com:443/CRCW0402301RFKED-Vishay-datasheet-13544682.pdf?src-supplier=Future+Electronics; ComponentLink15Description: https://datasheet.octopart.com:443/CRCW0402301RFKED-Vishay-datasheet-13544682.pdf?src-supplier=Future+Electronics; ComponentLink16URL: https://datasheet.octopart.com:443/CRCW0402301RFKED-Vishay-datasheet-12542115.pdf?src-supplier=Future+Electronics; ComponentLink16Description: https://datasheet.octopart.com:443/CRCW0402301RFKED-Vishay-datasheet-12542115.pdf?src-supplier=Future+Electronics; ComponentLink17URL: https://datasheet.octopart.com:443/CRCW0402301RFKED-Vishay-datasheet-12533120.pdf?src-supplier=Future+Electronics; ComponentLink17Description: https://datasheet.octopart.com:443/CRCW0402301RFKED-Vishay-datasheet-12533120.pdf?src-supplier=Future+Electronics; ComponentLink18URL: https://datasheet.octopart.com:443/CRCW0402301RFKED-Vishay-datasheet-12520421.pdf?src-supplier=Future+Electronics; ComponentLink18Description: https://datasheet.octopart.com:443/CRCW0402301RFKED-Vishay-datasheet-12520421.pdf?src-supplier=Future+Electronics; ComponentLink19URL: https://datasheet.octopart.com:443/CRCW0402301RFKED-Vishay-datasheet-12511221.pdf?src-supplier=Future+Electronics; ComponentLink19Description: https://datasheet.octopart.com:443/CRCW0402301RFKED-Vishay-datasheet-12511221.pdf?src-supplier=Future+Electronics; ComponentLink20URL: https://datasheet.octopart.com:443/CRCW0402301RFKED-Vishay-Dale-datasheet-47688880.pdf?src-supplier=RS+(Formerly+Allied+Electronics); ComponentLink20Description: https://datasheet.octopart.com:443/CRCW0402301RFKED-Vishay-Dale-datasheet-47688880.pdf?src-supplier=RS+(Formerly+Allied+Electronics); ComponentLink21URL: https://datasheet.octopart.com:443/CRCW0402301RFKED-Vishay-datasheet-12001583.pdf?src-supplier=RS+(Formerly+Allied+Electronics); ComponentLink21Description: https://datasheet.octopart.com:443/CRCW0402301RFKED-Vishay-datasheet-12001583.pdf?src-supplier=RS+(Formerly+Allied+Electronics); ComponentLink22URL: https://datasheet.octopart.com:443/CRCW0402301RFKED-Vishay-datasheet-5306405.pdf?src-supplier=RS+(Formerly+Allied+Electronics); ComponentLink22Description: https://datasheet.octopart.com:443/CRCW0402301RFKED-Vishay-datasheet-5306405.pdf?src-supplier=RS+(Formerly+Allied+Electronics); ComponentLink23URL: https://datasheet.octopart.com:443/CRCW0402301RFKED-Vishay-datasheet-11540273.pdf?src-supplier=Arrow+Electronics; ComponentLink23Description: https://datasheet.octopart.com:443/CRCW0402301RFKED-Vishay-datasheet-11540273.pdf?src-supplier=Arrow+Electronics; ComponentLink24URL: https://datasheet.octopart.com:443/CRCW0402301RFKED-Vishay-datasheet-8445837.pdf?src-supplier=element14; ComponentLink24Description: https://datasheet.octopart.com:443/CRCW0402301RFKED-Vishay-datasheet-8445837.pdf?src-supplier=element14; ComponentLink25URL: https://datasheet.octopart.com:443/CRCW0402301RFKED-Vishay-datasheet-5377255.pdf?src-supplier=Garrett; ComponentLink25Description: https://datasheet.octopart.com:443/CRCW0402301RFKED-Vishay-datasheet-5377255.pdf?src-supplier=Garrett; ComponentLink26URL: https://datasheet.octopart.com:443/CRCW0402301RFKED-Vishay-datasheet-148188.pdf?src-supplier=Garrett; ComponentLink26Description: https://datasheet.octopart.com:443/CRCW0402301RFKED-Vishay-datasheet-148188.pdf?src-supplier=Garrett; ComponentLink27URL: https://datasheet.octopart.com:443/CRCW0402301RFKED-Vishay-datasheet-42367.pdf?src-supplier=Garrett; ComponentLink27Description: https://datasheet.octopart.com:443/CRCW0402301RFKED-Vishay-datasheet-42367.pdf?src-supplier=Garrett; ComponentLink28URL: http://sigma.octopart.com:80/rohs_statement/Vishay-company-15.pdf?src-supplier=Compliance+Statements; ComponentLink28Description: http://sigma.octopart.com:80/rohs_statement/Vishay-company-15.pdf?src-supplier=Compliance+Statements
R_BUS1 = CMP-2001-04655-1: Manufacturer: KOA Speer; Part Number: RK73B2ATTD101J
R_NTC1 = CMP-2000-07451-1: Manufacturer: KOA Speer; Manufacturer Part Number: RK73H1ETTPD1002F; Power Rating: 100mW; Temperature Coefficient: 100ppm/°C; Tolerance: 1%; Voltage Rating: 75V; Voltage Rating (DC): 50V; Supplier: Mouser; Supplier Part Number: 660-RK73H1ETTPD1002F; RoHS: Compliant; Category: Chip SMD Resistors; Stock: 21454; Pricing: 1=0.1, 10=0.017, 50=0.017, 100=0.014, 1000=0.008, 10000=0.004 (USD); Case/Package: 0402; China RoHS: Non-Compliant; Composition: Thick Film; Country of Origin: Japan; Export Control Classification Number (ECCN) Code: EAR99; Height: 350µm; Harmonized Tariff Schedule (HTS) Code: 8533.21.00.30; Introduction Date: 2009-12-23; Lead Free: Lead Free; Length: 1mm; Lifecycle Status: Production; Max Operating Temperature: 155°C; Min Operating Temperature: -55°C; Mounting Technology: Surface Mount; Number of Terminals: 2; Ratings: AEC-Q200; REACH SVHC: Unaffected; Schedule B: 8533210045, 8533210045|8533210045, 8533210045|8533210045|8533210045, 8533210045|8533210045|8533210045|8533210045; Width: 500µm; Working Voltage: 75V; ComponentLink1URL: https://sigma.octopart.com:443/138820520/technical_drawing/KOA-Speer-RK73H1ETTPD1002F.pdf?src-supplier=Upverter; ComponentLink1Description: https://sigma.octopart.com:443/138820520/technical_drawing/KOA-Speer-RK73H1ETTPD1002F.pdf?src-supplier=Upverter; ComponentLink2URL: https://datasheet.octopart.com:443/RK73H1ETTPD1002F-KOA-Speer-datasheet-141253609.pdf?src-supplier=Upverter; ComponentLink2Description: https://datasheet.octopart.com:443/RK73H1ETTPD1002F-KOA-Speer-datasheet-141253609.pdf?src-supplier=Upverter; ComponentLink3URL: https://datasheet.octopart.com:443/RK73H1ETTPD1002F-KOA-Speer-datasheet-182143587.pdf?src-supplier=IHS; ComponentLink3Description: https://datasheet.octopart.com:443/RK73H1ETTPD1002F-KOA-Speer-datasheet-182143587.pdf?src-supplier=IHS; ComponentLink4URL: https://datasheet.octopart.com/RK73H-%7C-Flat-Chip-Resistors-%28Precision-Grade%29-KOA-Speer-datasheet-family-85.pdf; ComponentLink4Description: https://datasheet.octopart.com/RK73H-%7C-Flat-Chip-Resistors-%28Precision-Grade%29-KOA-Speer-datasheet-family-85.pdf; ComponentLink5URL: https://datasheet.octopart.com/RK73H1ETTPD1002F-KOA-Speer-datasheet-11590619.pdf; ComponentLink5Description: https://datasheet.octopart.com/RK73H1ETTPD1002F-KOA-Speer-datasheet-11590619.pdf; ComponentLink6URL: https://datasheet.octopart.com:443/RK73H1ETTPD1002F-KOA-Speer-datasheet-109211.pdf?src-supplier=Garrett; ComponentLink6Description: https://datasheet.octopart.com:443/RK73H1ETTPD1002F-KOA-Speer-datasheet-109211.pdf?src-supplier=Garrett; ComponentLink7URL: http://sigma.octopart.com:80/rohs_certificate/RK73H-%7C-Flat-Chip-Resistors-%28Precision-Grade%29-KOA-Speer-family-91.pdf?src-supplier=Compliance+Statements; ComponentLink7Description: http://sigma.octopart.com:80/rohs_certificate/RK73H-%7C-Flat-Chip-Resistors-%28Precision-Grade%29-KOA-Speer-family-91.pdf?src-supplier=Compliance+Statements
R_SENSE1 = CMP-26527-006578-1: General Purpose Thick Film Chip Resistor, 1206, 15mΩ, 1%, 0.5W; Temperature Coefficient: 100ppm/°C; Max Power Dissipation: 500mW; Length: 0.12inch; Mount: Surface Mount; Resistor Type: Thick Film; Number of Terminations: 2; Contact Plating: Tin; Max Operating Temperature: 155°C; Height: 0.026inch; Radiation Hardening: No; Case Code (Imperial): 1206; Width: 0.061inch; Tolerance: 1%; Series: CSR; RoHS Compliant: Yes; Case/Package: 1206; Min Operating Temperature: -55°C; Case Code (Metric): 3216; Packaging: Tape and Reel; Lead Free: Lead Free
RJ1 = CMP-009-00120-1: Pins: 2; Max Operating Temperature: 155°C; Min Operating Temperature: -55°C
TP1-TP8 = TEST POINT Ver.02
TVS1 = CMP-1060-00229-1: Manufacturer: Bourns; Manufacturer Part Number: SMBJ18CA-Q; Breakdown Voltage: 21.05V; Clamping Voltage: 29.2V; Max Breakdown Voltage: 22.1V; Min Breakdown Voltage: 20V; Number of Elements: 1; Peak Pulse Power: 600W; Peak Reverse Current: 1µA; Polarity: Bidirectional; Reverse Standoff Voltage: 18V; Supplier: Arrow Electronics; Supplier Part Number: SMBJ18CA-Q; RoHS: Compliant; Category: TVS Diodes; Stock: 5; Pricing: 5=0.131 (USD); China RoHS: Non-Compliant; Export Control Classification Number (ECCN) Code: EAR99; Harmonized Tariff Schedule (HTS) Code: 8541.10.00.50; Introduction Date: 2018-01-02; Lifecycle Status: Production; Max Operating Temperature: 150°C; Min Operating Temperature: -55°C; Number of Terminals: 2; Ratings: AEC-Q101; REACH SVHC: Affected; Schedule B: 8541100080, 8541100080|8541100080|8541100080|8541100080|8541100080; ComponentLink1URL: https://datasheet.octopart.com:443/SMBJ18CA-Q-Bourns-datasheet-179980062.pdf?src-supplier=TME; ComponentLink1Description: https://datasheet.octopart.com:443/SMBJ18CA-Q-Bourns-datasheet-179980062.pdf?src-supplier=TME; ComponentLink2URL: https://datasheet.octopart.com:443/SMBJ18CA-Q-Bourns-datasheet-154834311.pdf?src-supplier=Master+Electronics; ComponentLink2Description: https://datasheet.octopart.com:443/SMBJ18CA-Q-Bourns-datasheet-154834311.pdf?src-supplier=Master+Electronics; ComponentLink3URL: http://sigma.octopart.com:80/conflict_mineral_statement/Bourns-company-36.pdf?src-supplier=Compliance+Statements; ComponentLink3Description: http://sigma.octopart.com:80/conflict_mineral_statement/Bourns-company-36.pdf?src-supplier=Compliance+Statements
U1 = GeneratedSymbol_2: MOSFET Array, Dual P Channel, 60 V, 8 A, 48 Milliohms, SOIC, 8 Pins, Surface Mount; Manufacturer: Vishay; Continuous Drain Current (ID): 8A; Drain to Source Resistance: 48mΩ; Drain to Source Voltage (Vds): 60V; Max Power Dissipation: 5W; Number of Elements: 2; Supplier: Arrow Electronics; Supplier Part Number: SQ4917CEY-T1_GE3; Manufacturer Part Number: SQ4917CEY-T1_GE3; RoHS: Compliant; Category: MOSFETs; Stock: 5000; Pricing: 1=1.7867, 10=1.158, 50=0.935, 100=0.7846, 500=0.5451, 2500=0.5205 (USD); Country of Origin: Germany; Export Control Classification Number (ECCN) Code: EAR99; Harmonized Tariff Schedule (HTS) Code: 8541.29.00.95; Introduction Date: 2023-02-14; Lifecycle Status: Production; Max Operating Temperature: 175°C; Min Breakdown Voltage: 60V; Min Operating Temperature: -55°C; Number of Terminals: 8; Power Dissipation: 5W; Ratings: AEC-Q101; ComponentLink1URL: https://datasheet.octopart.com:443/SQ4917CEY-T1_GE3-Vishay-datasheet-181474669.pdf?src-supplier=IHS; ComponentLink1Description: https://datasheet.octopart.com:443/SQ4917CEY-T1_GE3-Vishay-datasheet-181474669.pdf?src-supplier=IHS; ComponentLink2URL: http://sigma.octopart.com:80/rohs_statement/Vishay-company-15.pdf?src-supplier=Compliance+Statements; ComponentLink2Description: http://sigma.octopart.com:80/rohs_statement/Vishay-company-15.pdf?src-supplier=Compliance+Statements
U2 = GeneratedSymbol: USB Type-C and BC1.2 5V 3.5A Output 36V Input Synchronous DC/DC Regulator 32-Pin VQFN; Manufacturer: Texas Instruments; Manufacturer Lifecycle Status: ACTIVE; Supplier: Arrow Electronics; Supplier Part Number: TPS25833QWRHBRQ1; Manufacturer Part Number: TPS25833QWRHBRQ1; RoHS: Compliant; Category: USB Interface ICs; Stock: 3000; Pricing: 3000=2.35 (USD); Case/Package: VQFN; Height: 1mm; Length: 5mm; Lifecycle Status: Production; Pins: 32; Schedule B: 8542390000|8542390000; Thickness: 900µm; Width: 5mm; ComponentLink1URL: https://octopart.com:443/opatz8j6/c1?t=QdtQ_5y6OoYO10vGMBHo0MkWWNg3WZcKByxVKRKibkrIArPmB0huZ0PTWgiVQyVM0r-KErAlqgl_GtZqS-zfbTH9MSEVf23tu6zsP7SwoH3cElgJzC1njavEoiPtv5zJyzI5TugnKjD-MwQN_tWNq7D4zs4hg9Jvnjhyur9u1VAzxy-x97OLvkn3T5o38e-A3hbTv1voPLaqbRoeq4uSWuj4oXJZ_6x5obgH2QuRMC6C-RM4You7UXlmIiUE0xXQlfjdTdGh5Mzji6m775kF51dkfg-oVXXT7eQkakUfxTXIZTGRZ9S2Te6OgLonkCf4Q48jzw2hIzpT3B6kxxuzoKhvga5DM2Eb2fh4XFQ3zjw1DN_Mg95a_8n3WVcIjlOyBCLqgiEN8_34Bg&src-supplier=Texas+Instruments; ComponentLink1Description: https://octopart.com:443/opatz8j6/c1?t=QdtQ_5y6OoYO10vGMBHo0MkWWNg3WZcKByxVKRKibkrIArPmB0huZ0PTWgiVQyVM0r-KErAlqgl_GtZqS-zfbTH9MSEVf23tu6zsP7SwoH3cElgJzC1njavEoiPtv5zJyzI5TugnKjD-MwQN_tWNq7D4zs4hg9Jvnjhyur9u1VAzxy-x97OLvkn3T5o38e-A3hbTv1voPLaqbRoeq4uSWuj4oXJZ_6x5obgH2QuRMC6C-RM4You7UXlmIiUE0xXQlfjdTdGh5Mzji6m775kF51dkfg-oVXXT7eQkakUfxTXIZTGRZ9S2Te6OgLonkCf4Q48jzw2hIzpT3B6kxxuzoKhvga5DM2Eb2fh4XFQ3zjw1DN_Mg95a_8n3WVcIjlOyBCLqgiEN8_34Bg&src-supplier=Texas+Instruments; ComponentLink2URL: https://datasheet.octopart.com:443/TPS25833QWRHBRQ1-Texas-Instruments-datasheet-165812046.pdf?src-supplier=SHENGYU+ELECTRONICS; ComponentLink2Description: https://datasheet.octopart.com:443/TPS25833QWRHBRQ1-Texas-Instruments-datasheet-165812046.pdf?src-supplier=SHENGYU+ELECTRONICS; ComponentLink3URL: http://sigma.octopart.com:80/reach_statement/Texas-Instruments-company-64.pdf?src-supplier=Compliance+Statements; ComponentLink3Description: http://sigma.octopart.com:80/reach_statement/Texas-Instruments-company-64.pdf?src-supplier=Compliance+Statements; ComponentLink4URL: http://sigma.octopart.com:80/conflict_mineral_statement/Texas-Instruments-company-63.pdf?src-supplier=Compliance+Statements; ComponentLink4Description: http://sigma.octopart.com:80/conflict_mineral_statement/Texas-Instruments-company-63.pdf?src-supplier=Compliance+Statements
ZD1 = CMP-1060-00307-1: ZENER DIODE SOD123 T&R 3K / Zener Diode 12 V 370 mW ±5.42% Surface Mount SOD-123; Manufacturer: Diodes Inc.; Manufacturer Part Number: BZT52C12Q-7-F; Impedance: 25Ω; Max Power Dissipation: 370mW; Number of Elements: 1; Peak Reverse Current: 100nA; Polarity: Unidirectional; Reference Voltage: 12V; Reverse Standoff Voltage: 8V; Voltage Tolerance: 5.39%; Zener Current: 5mA; Supplier: Avnet; Supplier Part Number: BZT52C12Q-7-F; RoHS: Compliant; Category: Zener Diodes; Stock: 90000; Pricing: 3000=0.02104, 6000=0.02089, 12000=0.02056, 24000=0.02024, 48000=0.02 (USD); China RoHS: Compliant; Composition: Zener; Lifecycle Status: Production; Max Operating Temperature: 150°C; Min Operating Temperature: -65°C; Number of Terminals: 2; Ratings: AEC-Q101; REACH SVHC: Unaffected; Schedule B: 8541100050, 8541100050|8541100050|8541100050|8541100050|8541100050; ComponentLink1URL: https://datasheet.octopart.com:443/BZT52C12Q-7-F-Diodes-Inc.-datasheet-101585693.pdf?src-supplier=HQonline; ComponentLink1Description: https://datasheet.octopart.com:443/BZT52C12Q-7-F-Diodes-Inc.-datasheet-101585693.pdf?src-supplier=HQonline